# Altium schematic sheet LevelTranslator_SOP_Socket_Multi_Power.SchDoc
size B; CompanyName: Microchip Technology Inc.; Organization: Microchip Technology; Address1: 2355 West Chandler Blvd.; Address2: Chandler, AZ  85224; Address4: USA; SheetNumber: 5; SheetTotal: 5; SheetTitle: **; Time: Time
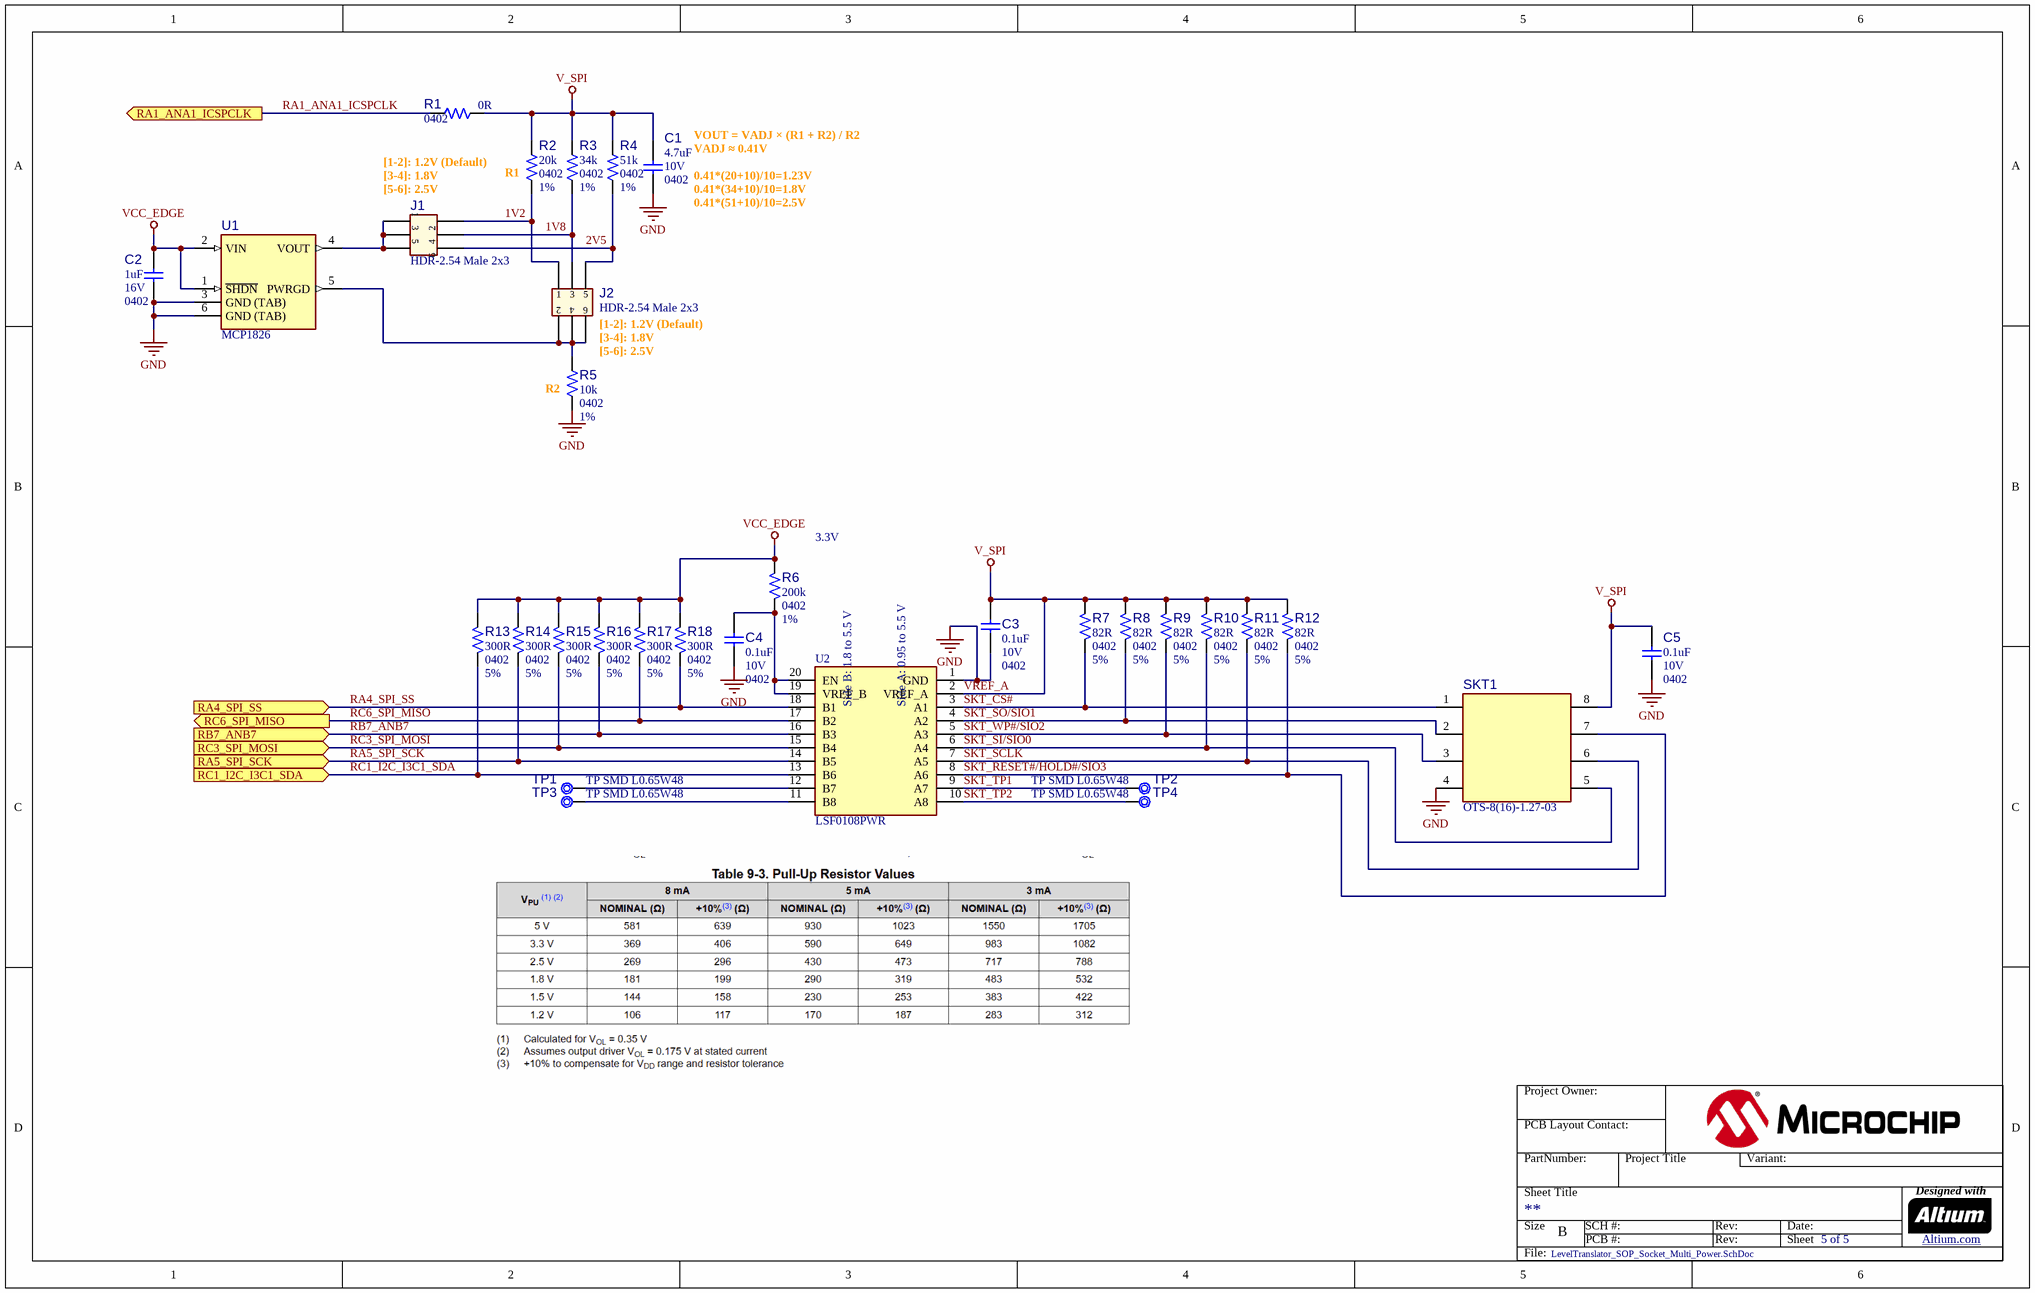
[diagram p0: LevelTranslator_SOP_Socket_Multi_Power.SchDoc]

## Parts
C1  value 4.7uF  Voltage: 10V  Package: 0402  [CAP_C_0402]  (hidden comment: Capacitor NP)
C2  value 1uF  Voltage: 16V  Package: 0402  [CAP_C_0402]  (hidden comment: Capacitor NP)
C3  value 0.1uF  Voltage: 10V  Package: 0402  [CAP_C_0402]  (hidden comment: Capacitor NP)
C4  value 0.1uF  Voltage: 10V  Package: 0402  [CAP_C_0402]  (hidden comment: Capacitor NP)
C5  value 0.1uF  Voltage: 10V  Package: 0402  [CAP_C_0402]  (hidden comment: Capacitor NP)
J1  value HDR-2.54 Male 2x3  [HDR_M_2.54_2x3]  (hidden comment: Header 2x3)
J2  value HDR-2.54 Male 2x3  [HDR_M_2.54_2x3]  (hidden comment: Header 2x3)
R1  value 0R  Package: 0402  [RES_C_0402]  (hidden comment: Resistor)
R2  value 20k  Package: 0402  Tolerance: 1%  [RES_C_0402]  (hidden comment: Resistor)
R3  value 34k  Package: 0402  Tolerance: 1%  [RES_C_0402]  (hidden comment: Resistor)
R4  value 51k  Package: 0402  Tolerance: 1%  [RES_C_0402]  (hidden comment: Resistor)
R5  value 10k  Package: 0402  Tolerance: 1%  [RES_C_0402]  (hidden comment: Resistor)
R6  value 200k  Package: 0402  Tolerance: 1%  [RES_C_0402]  (hidden comment: Resistor)
R7  value 82R  Package: 0402  Tolerance: 5%  [RES_C_0402]  (hidden comment: Resistor)
R8  value 82R  Package: 0402  Tolerance: 5%  [RES_C_0402]  (hidden comment: Resistor)
R9  value 82R  Package: 0402  Tolerance: 5%  [RES_C_0402]  (hidden comment: Resistor)
R10  value 82R  Package: 0402  Tolerance: 5%  [RES_C_0402]  (hidden comment: Resistor)
R11  value 82R  Package: 0402  Tolerance: 5%  [RES_C_0402]  (hidden comment: Resistor)
R12  value 82R  Package: 0402  Tolerance: 5%  [RES_C_0402]  (hidden comment: Resistor)
R13  value 300R  Package: 0402  Tolerance: 5%  [RES_C_0402]  (hidden comment: Resistor)
R14  value 300R  Package: 0402  Tolerance: 5%  [RES_C_0402]  (hidden comment: Resistor)
R15  value 300R  Package: 0402  Tolerance: 5%  [RES_C_0402]  (hidden comment: Resistor)
R16  value 300R  Package: 0402  Tolerance: 5%  [RES_C_0402]  (hidden comment: Resistor)
R17  value 300R  Package: 0402  Tolerance: 5%  [RES_C_0402]  (hidden comment: Resistor)
R18  value 300R  Package: 0402  Tolerance: 5%  [RES_C_0402]  (hidden comment: Resistor)
SKT1  value OTS-8(16)-1.27-03  [SO-8_150mil_Socket]  (hidden comment: Socket SOIC-8)
TP1  value TP SMD L0.65W48  [CON_TP_0.65_SMD]  (hidden comment: Test Point No BOM)  (no BOM)
TP2  value TP SMD L0.65W48  [CON_TP_0.65_SMD]  (hidden comment: Test Point No BOM)  (no BOM)
TP3  value TP SMD L0.65W48  [CON_TP_0.65_SMD]  (hidden comment: Test Point No BOM)  (no BOM)
TP4  value TP SMD L0.65W48  [CON_TP_0.65_SMD]  (hidden comment: Test Point No BOM)  (no BOM)
U1  value MCP1826  [SOT-223-5]  (hidden comment: MCP1826T-FIXED SOT-223-5)
U2  LSF0108PWR  [SOP65P640X120-20N]

## Ports
RA1_ANA1_ICSPCLK (out), RA4_SPI_SS (in), RA5_SPI_SCK (in), RB7_ANB7 (in), RC1_I2C_I3C1_SDA (in), RC3_SPI_MOSI (in), RC6_SPI_MISO (out)

## Nets
GND: C1.1 C2.1 C3.1 C4.1 C5.1 R5.1 SKT1.4 U1.3(GND_(TAB)) U1.6(GND_(TAB)) U2.1(GND)
VCC_EDGE: C2.2 R6.2 R13.2 R14.2 R15.2 R16.2 R17.2 R18.2 U1.1(~{SHDN}) U1.2(VIN)
VREF_A: C1.2 C3.2 C5.2 R1.2 R2.2 R3.2 R4.2 R7.2 R8.2 R9.2 R10.2 R11.2 R12.2 SKT1.8 U2.2(VREF_A)  [also labelled V_SPI]
1V2: J1.2 J2.1 R2.1
1V8: J1.4 J2.3 R3.1
2V5: J1.6 J2.5 R4.1
RA1_ANA1_ICSPCLK: R1.1 ; port RA1_ANA1_ICSPCLK
RA4_SPI_SS: R18.1 U2.18(B1) ; port RA4_SPI_SS
RA5_SPI_SCK: R14.1 U2.14(B5) ; port RA5_SPI_SCK
RB7_ANB7: R16.1 U2.16(B3) ; port RB7_ANB7
RC1_I2C_I3C1_SDA: R13.1 U2.13(B6) ; port RC1_I2C_I3C1_SDA
RC3_SPI_MOSI: R15.1 U2.15(B4) ; port RC3_SPI_MOSI
RC6_SPI_MISO: R17.1 U2.17(B2) ; port RC6_SPI_MISO
SKT_CS#: R7.1 SKT1.1 U2.3(A1)
SKT_RESET#/HOLD#/SIO3: R12.1 SKT1.7 U2.8(A6)
SKT_SCLK: R11.1 SKT1.6 U2.7(A5)
SKT_SI/SIO0: R10.1 SKT1.5 U2.6(A4)
SKT_SO/SIO1: R8.1 SKT1.2 U2.4(A2)
SKT_TP1: TP2.1 U2.9(A7)
SKT_TP2: TP4.1 U2.10(A8)
SKT_WP#/SIO2: R9.1 SKT1.3 U2.5(A3)
NetC4_2: C4.2 R6.1 U2.19(VREF_B) U2.20(EN)
NetJ1_1: J1.1 J1.3 J1.5 U1.4(VOUT)
NetJ2_2: J2.2 J2.4 J2.6 R5.2 U1.5(PWRGD)
NetTP1_1: TP1.1 U2.12(B7)
NetTP3_1: TP3.1 U2.11(B8)

## Notes on the sheet
- [1-2]: 1.2V (Default)
  [3-4]: 1.8V
  [5-6]: 2.5V
- (near R2) R1
- (near C1) VOUT = VADJ × (R1 + R2) / R2
  VADJ ≈ 0.41V
  0.41*(20+10)/10=1.23V
  0.41*(34+10)/10=1.8V
  0.41*(51+10)/10=2.5V
- (near J2) [1-2]: 1.2V (Default)
  [3-4]: 1.8V
  [5-6]: 2.5V
- (near R5) R2
- (near R6) 3.3V
- (near U2) Side B: 1.8 to 5.5 V
- (near U2) Side A: 0.95 to 5.5 V
- Project Owner:
- PCB Layout Contact:
- PartNumber:
- Project Title
- Variant:
- Sheet Title
- Size
- B
- SCH #:
- PCB #:
- Rev:
- Date:
- Sheet
- Designed with
- Altium.com <http://go.altium.com/MicrochipLandingPage_Evaluation.html>
- File:

## Library data of the parts
C1 = CAP1684: Manufacturer 1: TDK Corporation; Manufacturer Part Number 1: C1005X5R1A475K050BC; Description_: CAP CER 4.7uF 10V 10% X5R SMD 0402; Dev Tools Status: Production; Tolerance: 10%; Temperature Coefficient: X5R; Type: Ceramic; Owner: Jesus Aviles; Populated: YES; Restricted Sourcing: No; MCHP-ID: CAP1684; Revision: 2; Symbol: Capacitor NP; Status: MCL Design; ComponentLink1Description: SVN Datasheet; ComponentLink2Description: Local Datasheet; ComponentLink3URL: C:\ALTIUM_WORK\00001_MCHP-CDB\Library\LibraryRefs\Capacitor NP.SchLib; ComponentLink3Description: Open Symbol; ComponentLink4URL: C:\ALTIUM_WORK\00001_MCHP-CDB\Library\Footprints\CAP_C_0402.PcbLib; ComponentLink4Description: Open Footprint; ComponentLink5Description: Open Footprint 2; ComponentLink6Description: Open Footprint 3; ComponentLink7Description: Open Footprint 4; Operating Temperature: -55C to 85C; Category: Capacitor; Supplier 1: Digi-Key; Supplier Part Number 1: 445-13820-1-ND; Quantity Override: 1; Manufacturer 2: Samsung Electro-Mechanics; Manufacturer Part Number 2: CL05A475KP5NRNC; Supplier 2: Samsung Electro-Mechanics; Supplier Part Number 2: CL05A475KP5NRNC
C2 = CAP3233: Manufacturer 1: Murata; Manufacturer Part Number 1: GRM155C71C105KE11J; Description_: CAP CER 1uF 16V 10% X7S SMD 0402; Dev Tools Status: Design; Tolerance: 10%; Temperature Coefficient: X7S; Type: Ceramic; Owner: Florin Paun; Populated: YES; Restricted Sourcing: No; MCHP-ID: CAP3233; Revision: 1; Symbol: Capacitor NP; Status: MCL Design; ComponentLink1Description: SVN Datasheet; ComponentLink2Description: Local Datasheet; ComponentLink3URL: C:\ALTIUM_WORK\00001_MCHP-CDB\Library\LibraryRefs\Capacitor NP.SchLib; ComponentLink3Description: Open Symbol; ComponentLink4URL: C:\ALTIUM_WORK\00001_MCHP-CDB\Library\Footprints\CAP_C_0402.PcbLib; ComponentLink4Description: Open Footprint; ComponentLink5Description: Open Footprint 2; ComponentLink6Description: Open Footprint 3; ComponentLink7Description: Open Footprint 4; Operating Temperature: -55C to +125C; Category: Capacitor; Supplier 1: Digi-Key; Supplier Part Number 1: 490-GRM155C71C105KE11JTR-ND; Quantity Override: 1
C3-C5 = CAP3201: Manufacturer 1: Yageo; Manufacturer Part Number 1: CC0402KRX5R6BB104; Description_: CAP CER 0.1UF 10V ±10% X5R SMD 0402; Dev Tools Status: Production; Tolerance: 10%; Temperature Coefficient: X5R; Type: Ceramic; Owner: Balakumaran u s Umayi; Populated: YES; Restricted Sourcing: No; MCHP-ID: CAP3201; Revision: 1; Symbol: Capacitor NP; Status: MCL Design; ComponentLink1URL: https://chn-vm-apps.microchip.com/mchprepo/parts/Datasheets/CC0402KRX5R6BB104.pdf; ComponentLink1Description: SVN Datasheet; ComponentLink2URL: C:\ALTIUM_WORK\00001_MCHP-CDB\Datasheets\CC0402KRX5R6BB104.pdf; ComponentLink2Description: Local Datasheet; ComponentLink3URL: C:\ALTIUM_WORK\00001_MCHP-CDB\Library\LibraryRefs\Capacitor NP.SchLib; ComponentLink3Description: Open Symbol; ComponentLink4URL: C:\ALTIUM_WORK\00001_MCHP-CDB\Library\Footprints\CAP_C_0402.PcbLib; ComponentLink4Description: Open Footprint; ComponentLink5Description: Open Footprint 2; ComponentLink6Description: Open Footprint 3; ComponentLink7Description: Open Footprint 4; Operating Temperature: -55°C to 85°C; Category: Capacitor; Supplier 1: Digi-Key; Supplier Part Number 1: 311-1336-2-ND; Quantity Override: 1
J1 J2 = CON1117: Manufacturer 1: FCI; Manufacturer Part Number 1: 67996-406HLF; Description_: CON HDR-2.54 Male 2x3 Tin 5.84MH TH VERT; Dev Tools Status: Production; Owner: Bogdan P (M91398); Populated: Yes; Restricted Sourcing: No; MCHP-ID: CON1117; Revision: 1; Symbol: Header 2x3; Status: MCL Design; ComponentLink1Description: SVN Datasheet; ComponentLink2Description: Local Datasheet; ComponentLink3URL: C:\ALTIUM_WORK\00001_MCHP-CDB\Library\LibraryRefs\Header 2x3.SchLib; ComponentLink3Description: Open Symbol; ComponentLink4URL: C:\ALTIUM_WORK\00001_MCHP-CDB\Library\Footprints\HDR_M_2.54_2x3.PcbLib; ComponentLink4Description: Open Footprint; ComponentLink5Description: Open Footprint 2; ComponentLink6Description: Open Footprint 3; ComponentLink7Description: Open Footprint 4; Type: Header 2.54mm; Category: Connector; Manufacturer 2: SHENZHEN JUNHAO ENGINEERING; Manufacturer Part Number 2: 213-0617-0021-401; Supplier 1: Digi-Key; Supplier Part Number 1: 609-3218-ND; Supplier 2: SHENZHEN JUNHAO ENGINEERING; Supplier Part Number 2: 213-0617-0021-401; Quantity Override: 1
R1 = RES2693: Manufacturer 1: Bourns; Manufacturer Part Number 1: CR0402-J/-000GLF; Description_: RES TKF 0R 1/16W SMD 0402; Dev Tools Status: Production; Voltage: 50V; Temperature Coefficient: 100ppm/C; Current: 1A; Power: 1/16W; Owner: Dragos Danaila; Populated: YES; Restricted Sourcing: No; MCHP-ID: RES2693; Revision: 3; Symbol: Resistor; Status: MCL Design; ComponentLink1URL: https://chn-vm-apps.microchip.com/mchprepo/parts/Datasheets/crxxxxx.pdf; ComponentLink1Description: SVN Datasheet; ComponentLink2URL: C:\ALTIUM_WORK\00001_MCHP-CDB\Datasheets\crxxxxx.pdf; ComponentLink2Description: Local Datasheet; ComponentLink3URL: C:\ALTIUM_WORK\00001_MCHP-CDB\Library\LibraryRefs\Resistor.SchLib; ComponentLink3Description: Open Symbol; ComponentLink4URL: C:\ALTIUM_WORK\00001_MCHP-CDB\Library\Footprints\RES_C_0402.PcbLib; ComponentLink4Description: Open Footprint; ComponentLink5Description: Open Footprint 2; ComponentLink6Description: Open Footprint 3; ComponentLink7Description: Open Footprint 4; Operating Temperature: -55C to +155C; Category: Resistor; Type: RES SMD; Composition: TKF; Supplier 1: Digi-Key; Supplier Part Number 1: CR0402-J/-000GLFTR-ND; Quantity Override: 1
R2 = RSMT1238: Manufacturer 1: Yageo; Manufacturer Part Number 1: RC0402FR-0720KL; Description_: RES TKF 20K 1% 1/16W SMD 0402; Dev Tools Status: Production; Voltage: 100V; Temperature Coefficient: 100ppm/C; Current: 1A; Power: 1/16; Owner: Dragos Danaila; Populated: YES; Restricted Sourcing: No; MCHP-ID: RSMT1238; Revision: 1; Symbol: Resistor; Status: MCL Design; ComponentLink1URL: https://chn-vm-apps.microchip.com/mchprepo/parts/Datasheets/PYu-RC_Group_51_RoHS_L_9.pdf; ComponentLink1Description: SVN Datasheet; ComponentLink2URL: C:\ALTIUM_WORK\00001_MCHP-CDB\Datasheets\PYu-RC_Group_51_RoHS_L_9.pdf; ComponentLink2Description: Local Datasheet; ComponentLink3URL: C:\ALTIUM_WORK\00001_MCHP-CDB\Library\LibraryRefs\Resistor.SchLib; ComponentLink3Description: Open Symbol; ComponentLink4URL: C:\ALTIUM_WORK\00001_MCHP-CDB\Library\Footprints\RES_C_0402.PcbLib; ComponentLink4Description: Open Footprint; ComponentLink5Description: Open Footprint 2; ComponentLink6Description: Open Footprint 3; ComponentLink7Description: Open Footprint 4; Operating Temperature: -55C to +155C; Category: Resistor; Type: RES SMD; Composition: TKF; Supplier 1: Digi-Key; Supplier Part Number 1: 311-20.0KLRCT-ND; Quantity Override: 1
R3 = RES3581: Manufacturer 1: Yageo; Manufacturer Part Number 1: RC0402FR-0734KL; Description_: RES TKF 34k 1% 1/16W SMD 0402; Dev Tools Status: Design; Voltage: 100V; Temperature Coefficient: 100ppm/C; Power: 1/16W; Owner: Alexandru Chiser; Populated: YES; Restricted Sourcing: No; MCHP-ID: RES3581; Revision: 2; Symbol: Resistor; Status: MCL Design; ComponentLink1URL: https://chn-vm-apps.microchip.com/mchprepo/parts/Datasheets/PYU-RC_GROUP_51_ROHS_L.pdf; ComponentLink1Description: SVN Datasheet; ComponentLink2URL: C:\ALTIUM_WORK\00001_MCHP-CDB\Datasheets\PYU-RC_GROUP_51_ROHS_L.pdf; ComponentLink2Description: Local Datasheet; ComponentLink3URL: C:\ALTIUM_WORK\00001_MCHP-CDB\Library\LibraryRefs\Resistor.SchLib; ComponentLink3Description: Open Symbol; ComponentLink4URL: C:\ALTIUM_WORK\00001_MCHP-CDB\Library\Footprints\RES_C_0402.PcbLib; ComponentLink4Description: Open Footprint; ComponentLink5Description: Open Footprint 2; ComponentLink6Description: Open Footprint 3; ComponentLink7Description: Open Footprint 4; Operating Temperature: -55C to +155C; Category: Resistor; Type: RES SMD; Composition: TKF; Supplier 1: Digi-Key; Supplier Part Number 1: YAG3126CT-ND; Quantity Override: 1
R4 = RES2295: Manufacturer 1: Panasonic; Manufacturer Part Number 1: ERJ-2RKF5102X; Description_: RES TFK 51k 1% 1/10W SMD 0402; Dev Tools Status: Production; Voltage: 50V; Temperature Coefficient: 100ppm/C; Power: 1/10W; Owner: Jose Luis Caceres; Populated: YES; MCHP-ID: RES2295; Revision: 2; Symbol: Resistor; Status: MCL Design; ComponentLink1URL: https://chn-vm-apps.microchip.com/mchprepo/parts/Datasheets/AOA0000C304.pdf; ComponentLink1Description: SVN Datasheet; ComponentLink2URL: C:\ALTIUM_WORK\00001_MCHP-CDB\Datasheets\AOA0000C304.pdf; ComponentLink2Description: Local Datasheet; ComponentLink3URL: C:\ALTIUM_WORK\00001_MCHP-CDB\Library\LibraryRefs\Resistor.SchLib; ComponentLink3Description: Open Symbol; ComponentLink4URL: C:\ALTIUM_WORK\00001_MCHP-CDB\Library\Footprints\RES_C_0402.PcbLib; ComponentLink4Description: Open Footprint; ComponentLink5Description: Open Footprint 2; ComponentLink6Description: Open Footprint 3; ComponentLink7Description: Open Footprint 4; Operating Temperature: -55C to  +155C; Category: Resistor; Type: RES SMD; Composition: TKF; Supplier 1: Digi-Key; Supplier Part Number 1: P51.0KLCT-ND; Quantity Override: 1
R5 = RES2198: Manufacturer 1: Vishay; Manufacturer Part Number 1: MCS0402MC1002FE000; Description_: RES TF 10k 1% 1/10W SMD 0402 AEC-Q200; Dev Tools Status: Production; Temperature Coefficient: 50ppm/C; Power: 1/10W; Owner: Gabor Bihari; Populated: YES; Restricted Sourcing: No; MCHP-ID: RES2198; Revision: 1; Symbol: Resistor; Status: MCL Design; ComponentLink1URL: https://chn-vm-apps.microchip.com/mchprepo/parts/Datasheets/mcat_pro.pdf; ComponentLink1Description: SVN Datasheet; ComponentLink2URL: C:\ALTIUM_WORK\00001_MCHP-CDB\Datasheets\mcat_pro.pdf; ComponentLink2Description: Local Datasheet; ComponentLink3URL: C:\ALTIUM_WORK\00001_MCHP-CDB\Library\LibraryRefs\Resistor.SchLib; ComponentLink3Description: Open Symbol; ComponentLink4URL: C:\ALTIUM_WORK\00001_MCHP-CDB\Library\Footprints\RES_C_0402.PcbLib; ComponentLink4Description: Open Footprint; ComponentLink5Description: Open Footprint 2; ComponentLink6Description: Open Footprint 3; ComponentLink7Description: Open Footprint 4; Operating Temperature: -55°C to 175°C; Category: Resistor; Type: RES SMD; Composition: TF; Manufacturer 2: KOA Speer; Manufacturer Part Number 2: RK73G1ETTP1002F; Manufacturer 3: KOA Speer; Manufacturer Part Number 3: RK73H1ERTTP1002F; Supplier 1: Digi-Key; Supplier Part Number 1: MCS0402-10.0K-MFCT-ND; Supplier 2: Digi-Key; Supplier Part Number 2: 2019-RK73G1ETTP1002FCT-ND; Supplier 3: Digi-Key; Supplier Part Number 3: 2019-RK73H1ERTTP1002FCT-ND; Quantity Override: 1
R6 = RES2904: Manufacturer 1: Yageo; Manufacturer Part Number 1: RC0402FR-07200KL; Description_: RES TKF 200k 1% 1/16W SMD 0402; Dev Tools Status: Production; Temperature Coefficient: 100ppm/C; Power: 1/16W; Populated: YES; Owner: Balaji Narayana; Voltage: 50V; Current: 1A; MCHP-ID: RES2904; Revision: 1; Symbol: RESISTOR; Status: MCL Design; ComponentLink1URL: https://chn-vm-apps.microchip.com/mchprepo/parts/Datasheets/RC0402FR-07200KL.pdf; ComponentLink1Description: SVN Datasheet; ComponentLink2URL: C:\ALTIUM_WORK\00001_MCHP-CDB\Datasheets\RC0402FR-07200KL.pdf; ComponentLink2Description: Local Datasheet; ComponentLink3URL: C:\ALTIUM_WORK\00001_MCHP-CDB\Library\LibraryRefs\RESISTOR.SchLib; ComponentLink3Description: Open Symbol; ComponentLink4URL: C:\ALTIUM_WORK\00001_MCHP-CDB\Library\Footprints\RES_C_0402.PcbLib; ComponentLink4Description: Open Footprint; ComponentLink5Description: Open Footprint 2; ComponentLink6Description: Open Footprint 3; ComponentLink7Description: Open Footprint 4; Operating Temperature: -55C to +155C; Category: Resistor; Type: RES SMD; Composition: TKF; Supplier 1: Digi-Key; Supplier Part Number 1: 311-200KLRTR-ND; Quantity Override: 1
R7-R12 = RES2947: Manufacturer 1: Bourns; Manufacturer Part Number 1: CR0402-JW-820GLF; Description_: RES TKF 82R 5% 1/16W SMD 0402; Dev Tools Status: Production; Temperature Coefficient: 200ppm/C; Power: 1/16W; Owner: Sam Charles; Populated: YES; Restricted Sourcing: No; MCHP-ID: RES2947; Revision: 1; Symbol: Resistor; Status: MCL Design; ComponentLink1URL: https://chn-vm-apps.microchip.com/mchprepo/parts/Datasheets/cr.pdf; ComponentLink1Description: SVN Datasheet; ComponentLink2URL: C:\ALTIUM_WORK\00001_MCHP-CDB\Datasheets\cr.pdf; ComponentLink2Description: Local Datasheet; ComponentLink3URL: C:\ALTIUM_WORK\00001_MCHP-CDB\Library\LibraryRefs\Resistor.SchLib; ComponentLink3Description: Open Symbol; ComponentLink4URL: C:\ALTIUM_WORK\00001_MCHP-CDB\Library\Footprints\RES_C_0402.PcbLib; ComponentLink4Description: Open Footprint; ComponentLink5Description: Open Footprint 2; ComponentLink6Description: Open Footprint 3; ComponentLink7Description: Open Footprint 4; Operating Temperature: -55°C ~ 155°C; Category: Resistor; Type: RES SMD; Composition: TKF; Supplier 1: Digi-Key; Supplier Part Number 1: CR0402-JW-820GLFCT-ND; Quantity Override: 1
R13-R18 = RSMT1273: Manufacturer 1: Yageo; Manufacturer Part Number 1: RC0402JR-07300RL; Description_: RES TKF 300R 5% 1/16W SMD 0402; Dev Tools Status: Production; Temperature Coefficient: ±100ppm/°C; Power: 1/16W; Populated: YES; Owner: Jose Luis Caceres; MCHP-ID: RSMT1273; Revision: 1; Symbol: Resistor; Status: MCL Design; ComponentLink1URL: https://chn-vm-apps.microchip.com/mchprepo/parts/Datasheets/PYu-RC_Group_51_RoHS_L_10.pdf; ComponentLink1Description: SVN Datasheet; ComponentLink2URL: C:\ALTIUM_WORK\00001_MCHP-CDB\Datasheets\PYu-RC_Group_51_RoHS_L_10.pdf; ComponentLink2Description: Local Datasheet; ComponentLink3URL: C:\ALTIUM_WORK\00001_MCHP-CDB\Library\LibraryRefs\Resistor.SchLib; ComponentLink3Description: Open Symbol; ComponentLink4URL: C:\ALTIUM_WORK\00001_MCHP-CDB\Library\Footprints\RES_C_0402.PcbLib; ComponentLink4Description: Open Footprint; ComponentLink5Description: Open Footprint 2; ComponentLink6Description: Open Footprint 3; ComponentLink7Description: Open Footprint 4; Operating Temperature: -55C to +155C; Category: Resistor; Type: RES SMD; Composition: TKF; Supplier 1: Digi-Key; Supplier Part Number 1: 311-300JRCT-ND; Quantity Override: 1
SKT1 = SKT1089: Manufacturer 1: Enplas; Description_: SOCKET IC CLAMP SOP-8 SO-8; Dev Tools Status: Production; Owner: Alexandru Chiser - M19201; Populated: YES; Restricted Sourcing: No; MCHP-ID: SKT1089; Revision: 1; Symbol: Socket SOIC-8; Status: MCL Design; ComponentLink1URL: https://chn-vm-apps.microchip.com/mchprepo/parts/Datasheets/SOP_Enplas.pdf; ComponentLink1Description: SVN Datasheet; ComponentLink2URL: C:\ALTIUM_WORK\00001_MCHP-CDB\Datasheets\SOP_Enplas.pdf; ComponentLink2Description: Local Datasheet; ComponentLink3URL: C:\ALTIUM_WORK\00001_MCHP-CDB\Library\LibraryRefs\Socket SOIC-8.SchLib; ComponentLink3Description: Open Symbol; ComponentLink4URL: C:\ALTIUM_WORK\00001_MCHP-CDB\Library\Footprints\SO-8_150mil_Socket.PcbLib; ComponentLink4Description: Open Footprint; ComponentLink5Description: Open Footprint 2; ComponentLink6Description: Open Footprint 3; ComponentLink7Description: Open Footprint 4; Package: SOP-8 SO-8; Type: IC; Category: Socket; Manufacturer Part Number 1: OTS-8(16)-1.27-03; Supplier 1: WaveShare; Supplier Part Number 1: OTS-8(16)-1.27-03; Quantity Override: 1
TP1-TP4 = CON2121: Test Point; Description_: CON TP PAD PCB SMD L0.65W48; Dev Tools Status: Design; Owner: Sam Charles; Populated: DNP; MCHP-ID: CON2121; Revision: 1; Symbol: Test Point No BOM; Status: MCL Design; ComponentLink1Description: SVN Datasheet; ComponentLink2Description: Local Datasheet; ComponentLink3URL: C:\ALTIUM_WORK\00001_MCHP-CDB\Library\LibraryRefs\Test Point No BOM.SchLib; ComponentLink3Description: Open Symbol; ComponentLink4URL: C:\ALTIUM_WORK\00001_MCHP-CDB\Library\Footprints\CON_TP_0.65_SMD.PcbLib; ComponentLink4Description: Open Footprint; ComponentLink5Description: Open Footprint 2; ComponentLink6Description: Open Footprint 3; ComponentLink7Description: Open Footprint 4; Type: Test Point No BOM; Category: Connector; Quantity Override: 1; Restricted Sourcing: No
U1 = MIC9200: Manufacturer 1: Microchip Technology; Manufacturer Part Number 1: MCP1826T-1802E/DC; Description_: MCHP ANALOG LDO 1.8V MCP1826T-1802E/DC SOT-223-5; Dev Tools Status: Production; Owner: Jesus Aviles; Populated: YES; Restricted Sourcing: No; MCHP-ID: MIC9200; Symbol: MCP1826T-FIXED SOT-223-5; Type: LDO; Status: MCL Design; Revision: 2; Category: MCHP-Analog; ComponentLink1URL: https://chn-vm-apps.microchip.com/mchprepo/parts/Datasheets/22057B.pdf; ComponentLink1Description: SVN Datasheet; ComponentLink2URL: C:\ALTIUM_WORK\00001_MCHP-CDB\Datasheets\22057B.pdf; ComponentLink2Description: Local Datasheet; ComponentLink3URL: C:\ALTIUM_WORK\00001_MCHP-CDB\Library\LibraryRefs\MCP1826T-FIXED SOT-223-5.SchLib; ComponentLink3Description: Open Symbol; ComponentLink4URL: C:\ALTIUM_WORK\00001_MCHP-CDB\Library\Footprints\SOT-223-5.PcbLib; ComponentLink4Description: Open Footprint; ComponentLink5Description: Open Footprint 2; ComponentLink6Description: Open Footprint 3; ComponentLink7Description: Open Footprint 4; Supplier 1: Microchip Technology; Supplier Part Number 1: MCP1826T-1802E/DC; Operating Temperature: -40C to +125C; Quantity Override: 1
U2 = LSF0108PWR: Integrated Circuit; Manufacturer_Name: Texas Instruments; Datasheet Link: https://www.ti.com/lit/ds/symlink/lsf0108.pdf?ts=1598697110983&ref_url=https%253A%252F%252Fwww.ti.com%252Fstore%252Fti%252Fen%252Fp%252Fproduct%252F%253Fp%253DLSF0108PWR%2526keyMatch%253DLSF0108PWR%2526tisearch%253DSearch-EN-everything%2526usecase%253DOPN; Height: 1.2mm; Manufacturer_Part_Number: LSF0108PWR; Mouser Part Number: 595-LSF0108PWR; Mouser Price/Stock: https://www.mouser.co.uk/ProductDetail/Texas-Instruments/LSF0108PWR?qs=MJut%252BdqOEgjIYRbmgD64ig%3D%3D; Arrow Part Number: LSF0108PWR; Arrow Price/Stock: https://www.arrow.com/en/products/lsf0108pwr/texas-instruments.html?utm_currency=USD&region=nac